# Altium schematic sheet MIPI_DISPLAY-SHEET.SchDoc
size A4; SheetNumber: 6; SheetTotal: 10
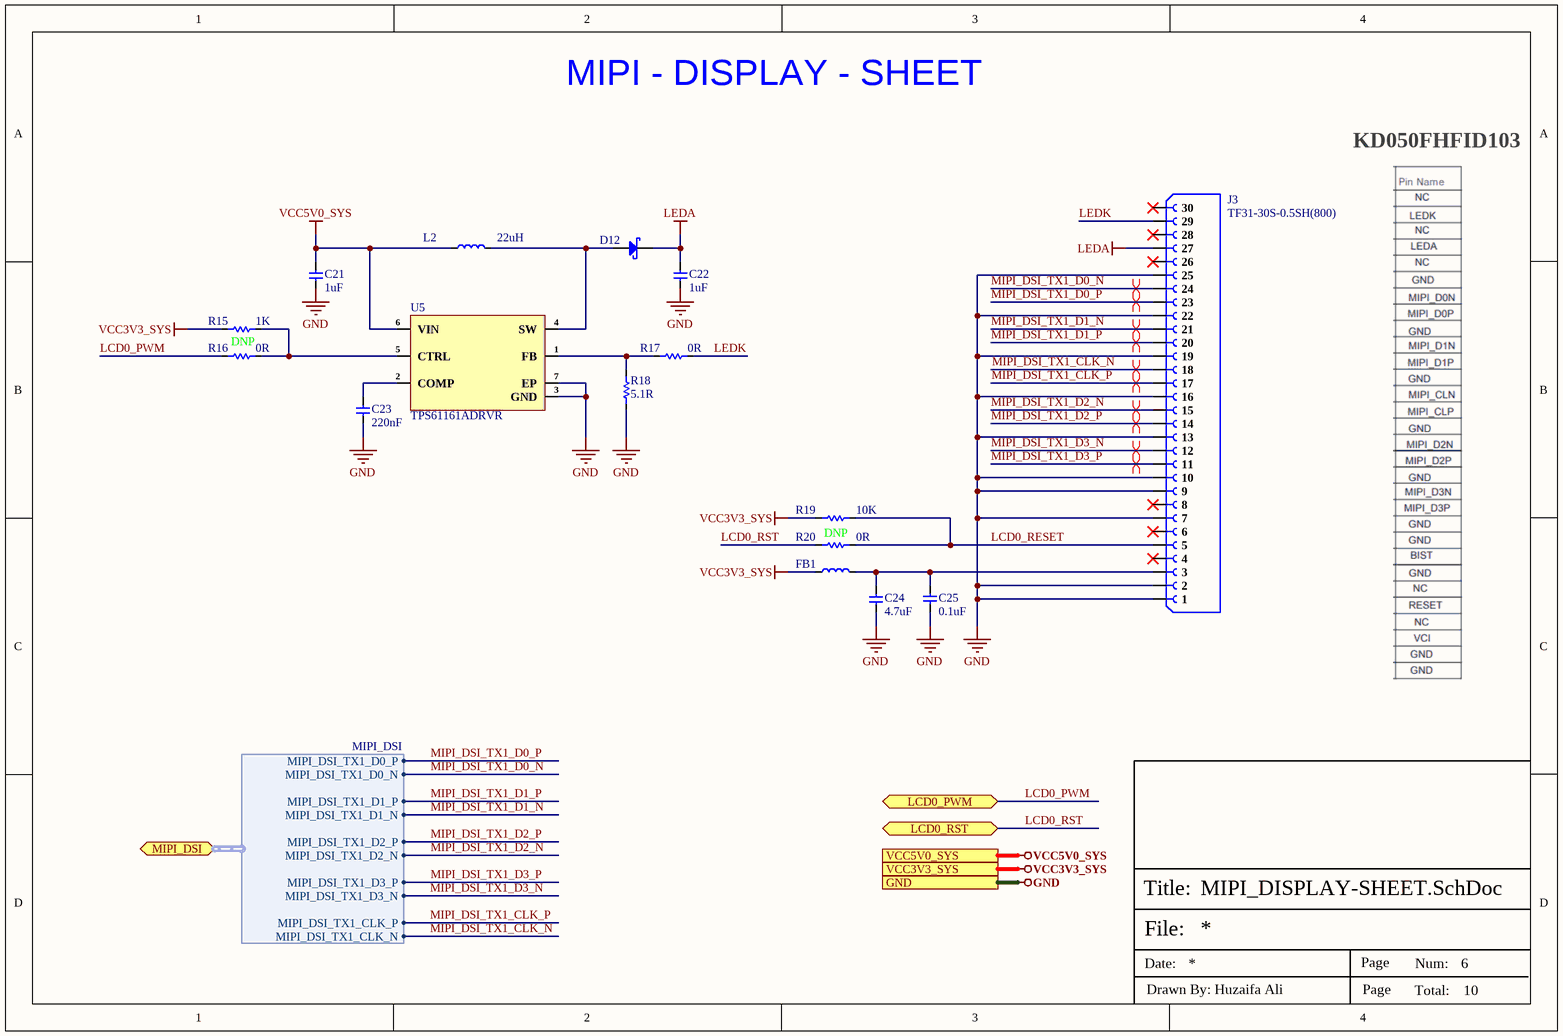
[diagram p0: MIPI_DISPLAY-SHEET.SchDoc]

## Parts
C21  1uF  [Cap-0603]
C22  1uF  [Cap-0603]
C23  220nF  [Cap-0402]
C24  4.7uF  [Cap-0402]
C25  0.1uF  [Cap-0402]
D12  SS16  [SMA]  (value not drawn)
FB1  BLM18PG181SN1D  [IND-0603 (1608 Metric)]  (value not drawn)
J3  TF31-30S-0.5SH(800)  [TF31-30S-0.5SH(800)]
L2  22uH  [VLCF5020T-220MR75-1]
R15  1K  [Res-0402]
R16  DNP  [Res-0402]
R17  0R  [Res-0402]
R18  5.1R  [RES-0805]
R19  10K  [Res-0402]
R20  DNP  [Res-0402]
U5  TPS61161ADRVR  [WSON-6-EP(2x2)]

## Ports
GND (see CAN_SHEET[3D], GPS_INTERFACE_SHEET[3D], HDMI2.0_SHEET[3D], JOYSTICK_BUTTON_SHEET[3D], MISCELLANEOUS_SHEET[3D], POWER_SHEET[3C], radxa_CM3J_SHEET-1[4C], radxa_CM3J_SHEET-2[3D], TYPE-C_INTERFACE_SHEET[3D]), LCD0_PWM (bidir, see radxa_CM3J_SHEET-1[4C]), LCD0_RST (bidir, see radxa_CM3J_SHEET-1[4C]), MIPI_DSI (bidir, harness MIPI_DSI, see radxa_CM3J_SHEET-2[1D]), VCC3V3_SYS (see GPS_INTERFACE_SHEET[3D], HDMI2.0_SHEET[3D], MISCELLANEOUS_SHEET[3D], POWER_SHEET[3C]), VCC5V0_SYS (see CAN_SHEET[3D], HDMI2.0_SHEET[3D], POWER_SHEET[3C], radxa_CM3J_SHEET-1[4C], TYPE-C_INTERFACE_SHEET[3D])

## Harnesses
MIPI_DSI: MIPI_DSI_TX1_D0_P, MIPI_DSI_TX1_D0_N, MIPI_DSI_TX1_D1_P, MIPI_DSI_TX1_D1_N, MIPI_DSI_TX1_D2_P, MIPI_DSI_TX1_D2_N, MIPI_DSI_TX1_D3_P, MIPI_DSI_TX1_D3_N, MIPI_DSI_TX1_CLK_P, MIPI_DSI_TX1_CLK_N

## Nets
GND: C21.1 C22.1 C23.1 C24.1 C25.2 J3.1 J3.2 J3.7 J3.9 J3.10 J3.13 J3.16 J3.19 J3.22 J3.25 R18.1 U5.3(GND) U5.7(EP) ; port GND
LEDA: C22.2 D12.1(K) J3.27
VCC3V3_SYS: FB1.1 R15.2 R19.2 ; port VCC3V3_SYS
VCC5V0_SYS: C21.2 L2.1 U5.6(VIN) ; port VCC5V0_SYS
LCD0_PWM: R16.1 ; port LCD0_PWM
LCD0_RESET: J3.5 R19.1 R20.2
LCD0_RST: R20.1 ; port LCD0_RST
LEDK: J3.29 R17.2
MIPI_DSI_TX1_CLK_N: J3.18 ; port MIPI_DSI.MIPI_DSI_TX1_CLK_N
MIPI_DSI_TX1_CLK_P: J3.17 ; port MIPI_DSI.MIPI_DSI_TX1_CLK_P
MIPI_DSI_TX1_D0_N: J3.24 ; port MIPI_DSI.MIPI_DSI_TX1_D0_N
MIPI_DSI_TX1_D0_P: J3.23 ; port MIPI_DSI.MIPI_DSI_TX1_D0_P
MIPI_DSI_TX1_D1_N: J3.21 ; port MIPI_DSI.MIPI_DSI_TX1_D1_N
MIPI_DSI_TX1_D1_P: J3.20 ; port MIPI_DSI.MIPI_DSI_TX1_D1_P
MIPI_DSI_TX1_D2_N: J3.15 ; port MIPI_DSI.MIPI_DSI_TX1_D2_N
MIPI_DSI_TX1_D2_P: J3.14 ; port MIPI_DSI.MIPI_DSI_TX1_D2_P
MIPI_DSI_TX1_D3_N: J3.12 ; port MIPI_DSI.MIPI_DSI_TX1_D3_N
MIPI_DSI_TX1_D3_P: J3.11 ; port MIPI_DSI.MIPI_DSI_TX1_D3_P
NetC23_2: C23.2 U5.2(COMP)
NetC24_2: C24.2 C25.1 FB1.2 J3.3
NetD12_2: D12.2(A) L2.2 U5.4(SW)
NetR15_1: R15.1 R16.2 U5.5(CTRL)
NetR17_1: R17.1 R18.2 U5.1(FB)

Not connected (* = marked no-connect by the designer): J3 4* 6* 8* 26* 28* 30*

## Layout directives
differential pair; differential pair class MIPI; rule Impedance Constraint [Min = 97.00    Max = 103.0    ]: MIPI_DSI_TX1_CLK_N, MIPI_DSI_TX1_CLK_P, MIPI_DSI_TX1_D0_N, MIPI_DSI_TX1_D0_P, MIPI_DSI_TX1_D1_N, MIPI_DSI_TX1_D1_P, MIPI_DSI_TX1_D2_N, MIPI_DSI_TX1_D2_P, MIPI_DSI_TX1_D3_N, MIPI_DSI_TX1_D3_P

## Notes on the sheet
- MIPI - DISPLAY - SHEET
- KD050FHFID103
- (near R16) 0R
- (near R20) 0R
- File:
- Title:
- Date:
- Page
- Num:
- Total:
- Drawn By: Huzaifa Ali

## Library data of the parts
C21 C22 = CL10A105KB8NNNC: CAP CER 1UF 50V X5R 0603; Manufacturer: Samsung; Material: 4241ConductorMaterial; Tolerance: 10%; Item Type: Capacitor; Supplier: Avnet; Supplier Part Number: CL10A105KB8NNNC; Manufacturer Part Number: CL10A105KB8NNNC; RoHS: Yes; Category: Ceramic Capacitors; Stock: 780446; Pricing: 4000=0.01632, 8000=0.01595, 16000=0.01557, 24000=0.0152, 32000=0.01482 (USD); Mounting Technology: Surface Mount; Case/Package: 0603; Case Code (Metric): 1608; Case Code (Imperial): 0603; Min Operating Temperature: -55°C; Max Operating Temperature: 85°C; Packaging: Tape and Reel; Value: 1uF; Voltage Rating: 50V; Dielectric: X5R; Series: CL; Voltage Rating (DC): 50V; Length: 1.6mm; Depth: 0.8mm; Radiation Hardening: No; RoHS Compliant: Yes; ComponentLink1URL: https://datasheet.ciiva.com/26877/getdatasheetpartid-753736-26877879.pdf?src-supplier=Verical; ComponentLink1Description: https://datasheet.ciiva.com/26877/getdatasheetpartid-753736-26877879.pdf?src-supplier=Verical; LCSC Part Number: C15849
C23 = CC0402KRX5R8BB224: CAP CER 0.22UF 25V X5R 0402; Manufacturer: Yageo; Item Type: Capacitors; Tolerance: 10%; Supplier 1: Mouser; Manufacturer Part Number: CC0402KRX5R8BB224; RoHS: Yes; Stock 1: 61266; Pricing 1: 1=0.10000, 10=0.03300, 50=0.03300, 100=0.02700, 1000=0.01500, 10000=0.01300 (USD); Mount: Surface Mount; Case/Package: 0402; Min Operating Temperature: -55°C; Max Operating Temperature: 85°C; Packaging: Tape and Reel; Capacitance: 220nF; Voltage Rating: 25V; Voltage Rating (DC): 25V; Dielectric: X5R; Length: 0.039inch; Width: 0.02inch; Thickness: 0.022inch; Lead Free: Lead Free; Halogen Free: Halogen Free; RoHS Compliant: Yes; ComponentLink1URL: http://www.yageo.com/documents/recent/UPY-GPHC_X5R_4V-to-50V_25.pdf?src-supplier=Digi-Key; ComponentLink1Description: http://www.yageo.com/documents/recent/UPY-GPHC_X5R_4V-to-50V_25.pdf?src-supplier=Digi-Key; ComponentLink2URL: https://www.yageo.com/upload/media/product/productsearch/datasheet/mlcc/UPY-GPHC_X5R_4V-to-50V_26.pdf?src-supplier=Digi-Key; ComponentLink2Description: https://www.yageo.com/upload/media/product/productsearch/datasheet/mlcc/UPY-GPHC_X5R_4V-to-50V_26.pdf?src-supplier=Digi-Key; ComponentLink3URL: http://www.yageo.com/documents/recent/UPY-GPHC_X5R_4V-to-50V_23.pdf?src-supplier=Digi-Key; ComponentLink3Description: http://www.yageo.com/documents/recent/UPY-GPHC_X5R_4V-to-50V_23.pdf?src-supplier=Digi-Key; Supplier Part Number 1: 603-CC402KRX5R8BB224; LCSC Part Number: C326836
C24 = CC0402KRX5R6BB475: CAP CER 4.7UF 10V X5R 0402; Manufacturer: Yageo; Tolerance: 10%; Supplier 1: Farnell; Manufacturer Part Number: CC0402KRX5R6BB475; RoHS: Yes; Category: Ceramic Capacitors; Stock 1: 20000; Pricing 1: 10000=0.02310, 50000=0.02100 (GBP); Mount: Surface Mount; Case/Package: 0402; Case Code (Imperial): 0402; Case Code (Metric): 1005; Min Operating Temperature: -55°C; Max Operating Temperature: 85°C; Packaging: Cut Tape; Capacitance: 4.7uF; Voltage Rating: 10V; RoHS Compliant: Yes; ComponentLink1URL: http://www.yageo.com/documents/recent/UPY-GPHC_X5R_4V-to-50V_25.pdf?src-supplier=Digi-Key; ComponentLink1Description: http://www.yageo.com/documents/recent/UPY-GPHC_X5R_4V-to-50V_25.pdf?src-supplier=Digi-Key; Supplier Part Number 1: 3871698; LCSC Part Number: C326586
C25 = GRM155R71H104ME14D: CAP CER 0.1UF 50V X7R 0402; Manufacturer: Murata; Tolerance: 20%; Capacitance: 100nF; Item Type: Capacitor; Supplier 1: Avnet; Manufacturer Part Number: GRM155R71H104ME14D; RoHS: Yes; Category: Ceramic Capacitors; Stock 1: 100000; Pricing 1: 10000=0.00444, 20000=0.00420, 40000=0.00396, 60000=0.00372, 80000=0.00348, 100000=0.00324, 1000000=0.00300 (USD); Mount: Surface Mount; Case/Package: 0402; Min Operating Temperature: -55°C; Max Operating Temperature: 125°C; Packaging: Cut Tape; Voltage Rating: 50V; Length: 0.039inch; Width: 0.02inch; Thickness: 0.022inch; RoHS Compliant: Yes; ComponentLink1URL: http://www.mouser.com/ds/2/281/c02e-2905.pdf?src-supplier=Mouser; ComponentLink1Description: http://www.mouser.com/ds/2/281/c02e-2905.pdf?src-supplier=Mouser; ComponentLink2URL: http://search.murata.co.jp/Ceramy/image/img/A01X/G101/ENG/GRM155R71H104ME14-01.pdf?src-supplier=Digi-Key; ComponentLink2Description: http://search.murata.co.jp/Ceramy/image/img/A01X/G101/ENG/GRM155R71H104ME14-01.pdf?src-supplier=Digi-Key; ComponentLink3URL: http://psearch.en.murata.com/capacitor/product/GRM155R71H104ME14%23.pdf?src-supplier=Avnet; ComponentLink3Description: http://psearch.en.murata.com/capacitor/product/GRM155R71H104ME14%23.pdf?src-supplier=Avnet; Supplier Part Number 1: GRM155R71H104ME14D; LCSC Part Number: C182412
D12 = SS16: 60V 700mV@1A 1A SMA(DO-214AC) Schottky Barrier Diodes (SBD) ROHS; Manufacturer: MDD; Item Type: Schottky Diode; Manufacturer Part Number: SS16; Package: SMA(DO-214AC); LCSC Part Number: C2481; ComponentLink1Description: LCSC; ComponentLink1URL: https://www.lcsc.com/product-detail/Schottky-Barrier-Diodes-SBD_MDD-Microdiode-Electronics-SS16_C2481.html
FB1 = BLM18PG181SN1D: 0603 180Ω ±25% DCR=0.09Ω 1.5A; Manufacturer: Murata; Manufacturer Series: BLM18P; Core Material: Ferrite; Material: Ferrite,Steel; Impedance: 180R; Number of Lines: 1; DC Resistance (DCR): 90mR; Test Frequency: 100MHz; Shielding: Unshielded; Item Type: Ferrite Bead; Supplier 1: Arrow Electronics; Manufacturer Part Number: BLM18PG181SN1D; RoHS: Yes; Category: Inductors; Stock 1: 13; Pricing 1: 1=0.08740, 10=0.06280 (USD); Case/Package: 0603; Number of Pins: 2; Case Code (Metric): 1608; Case Code (Imperial): 0603; Terminal Finish: Tin; Min Operating Temperature: -55°C; Max Operating Temperature: 125°C; Package Quantity: 1; Tolerance: 25%; Packaging: Tape and Reel; Current Rating: 1.5A; Max Current Rating: 1.5A; Max DC Current: 1.5A; Termination: SMD/SMT; DC Current: 1.5A; Number of Circuits: 1; Series: BLM18P; Number of Functions: 1; DC Resistance-Max: 90mR; Length: 1.6mm; Width: 0.8mm; Height: 0.8mm; Depth: 0.8mm; Radiation Hardening: No; REACH SVHC: No SVHC; Lead Free: Lead Free; RoHS Compliant: Yes; ComponentLink1URL: https://datasheet.ciiva.com/36526/1845021-36526048.pdf?src-supplier=Jameco; ComponentLink1Description: https://datasheet.ciiva.com/36526/1845021-36526048.pdf?src-supplier=Jameco; ComponentLink2URL: https://datasheet.ciiva.com/11800/0900766b81275ca5-11800854.pdf?src-supplier=RSComponents; ComponentLink2Description: https://datasheet.ciiva.com/11800/0900766b81275ca5-11800854.pdf?src-supplier=RSComponents; ComponentLink3URL: https://datasheet.ciiva.com/29347/442378-da-01-en-chip-drossel-0603-180r-1500ma-1-6x0-8mm-29347913.pdf?src-supplier=Conrad; ComponentLink3Description: https://datasheet.ciiva.com/29347/442378-da-01-en-chip-drossel-0603-180r-1500ma-1-6x0-8mm-29347913.pdf?src-supplier=Conrad; ComponentLink4URL: https://datasheet.ciiva.com/8021/5148-8021478.pdf?src-supplier=Element14; ComponentLink4Description: https://datasheet.ciiva.com/8021/5148-8021478.pdf?src-supplier=Element14; ComponentLink5URL: https://datasheet.ciiva.com/8021/5148-8021496.pdf?src-supplier=Element14; ComponentLink5Description: https://datasheet.ciiva.com/8021/5148-8021496.pdf?src-supplier=Element14; ComponentLink6URL: https://datasheet.ciiva.com/1012/l0110s0100blm18p-1012153.pdf?src-supplier=Digi-Key; ComponentLink6Description: https://datasheet.ciiva.com/1012/l0110s0100blm18p-1012153.pdf?src-supplier=Digi-Key; ComponentLink7URL: https://datasheet.ciiva.com/1012/l0110s0100blm18p-1012152.pdf?src-supplier=Digi-Key; ComponentLink7Description: https://datasheet.ciiva.com/1012/l0110s0100blm18p-1012152.pdf?src-supplier=Digi-Key; ComponentLink8URL: https://datasheet.ciiva.com/1012/l0110s0100blm18p-1012154.pdf?src-supplier=Digi-Key; ComponentLink8Description: https://datasheet.ciiva.com/1012/l0110s0100blm18p-1012154.pdf?src-supplier=Digi-Key; ComponentLink9URL: https://datasheet.ciiva.com/8084/l0110s0100blm18p-8084296.pdf?src-supplier=Avnet; ComponentLink9Description: https://datasheet.ciiva.com/8084/l0110s0100blm18p-8084296.pdf?src-supplier=Avnet; ComponentLink10URL: https://datasheet.ciiva.com/16394/l0110s0100blm18p-16394029.pdf?src-supplier=Future+Electronics; ComponentLink10Description: https://datasheet.ciiva.com/16394/l0110s0100blm18p-16394029.pdf?src-supplier=Future+Electronics; Supplier Part Number 1: BLM18PG181SN1D; LCSC Part Number: C82850
J3 = TF31-30S-0.5SH(800): CONN FFC BOTTOM 30POS 0.5MM R/A; Manufacturer: Hirose; Item Type: FFC / FPC Connector; Supplier: Digikey; Supplier Part Number: 26-TF31-30S-0.5SH(800)CT-ND; Manufacturer Part Number: TF31-30S-0.5SH(800); RoHS: Yes; Stock: 14095; Pricing: 1=2.37, 10=2.065, 25=1.9772, 50=1.9332, 100=1.8453, 250=1.66952, 500=1.53772, 1000=1.31805 (USD); ComponentLink1URL: https://www.hirose.com/product/download/?distributor=digikey&amp;type=specSheet&amp;lang=en&amp;num=TF31-30S-0.5SH(800)&src-supplier=Digikey; ComponentLink1Description: https://www.hirose.com/product/download/?distributor=digikey&amp;type=specSheet&amp;lang=en&amp;num=TF31-30S-0.5SH(800)&src-supplier=Digikey; ComponentLink2URL: https://datasheet.octopart.com/TF31-30S-0.5SH%28800%29-Hirose-datasheet-138123803.pdf?src-supplier=Sager+Electronics; ComponentLink2Description: https://datasheet.octopart.com/TF31-30S-0.5SH%28800%29-Hirose-datasheet-138123803.pdf?src-supplier=Sager+Electronics; LCSC Part Number: C5137133
L2 = VLCF5020T-220MR75-1: FIXED IND 22UH 750MA 496MOHM SMD; Manufacturer: TDK; Item Type: Inductors; Supplier: Avnet; LCSC Part Number: C87576; Manufacturer Part Number: VLCF5020T-220MR75-1; RoHS: Yes; Stock: 1000; Pricing: 500=0.2562 (USD); ComponentLink1URL: https://datasheet.ciiva.com/11800/0900766b807a173e-11800091.pdf?src-supplier=Rs; ComponentLink1Description: https://datasheet.ciiva.com/11800/0900766b807a173e-11800091.pdf?src-supplier=Rs; ComponentLink2URL: https://datasheet.ciiva.com/4956/e531-vlcf-18500-4956649.pdf?src-supplier=Mouser; ComponentLink2Description: https://datasheet.ciiva.com/4956/e531-vlcf-18500-4956649.pdf?src-supplier=Mouser; ComponentLink3URL: https://datasheet.ciiva.com/8045/516785-8045801.pdf?src-supplier=Element14; ComponentLink3Description: https://datasheet.ciiva.com/8045/516785-8045801.pdf?src-supplier=Element14; ComponentLink4URL: https://datasheet.ciiva.com/22725/516785-22725947.pdf?src-supplier=Element14; ComponentLink4Description: https://datasheet.ciiva.com/22725/516785-22725947.pdf?src-supplier=Element14
R15 = RC0402FR-071KL: RES 1K OHM 1% 1/16W 0402; Manufacturer: Yageo; Resistance: 1kR; Temperature Coefficient: 100ppm/°C; Voltage Rating (DC): 50V; Power Rating: 62.5mW; Max Power Dissipation: 63mW; Item Type: Resistor; Supplier 1: Avnet; Manufacturer Part Number: RC0402FR-071KL; RoHS: Yes; Category: Chip SMD Resistors; Stock 1: 13030000; Pricing 1: 10000=0.00085, 20000=0.00087, 40000=0.00084, 60000=0.00083, 80000=0.00079, 100000=0.00078, 1000000=0.00076 (USD); Case/Package: 0402; Number of Pins: 2; Case Code (Imperial): 0402; Case Code (Metric): 1005; Size Code: 0402; Min Operating Temperature: -55°C; Max Operating Temperature: 155°C; Resistor Type: Thick Film; Tolerance: 1%; Packaging: Tape and Reel; Voltage Rating: 50V; Termination: SMD/SMT; Features: Moisture Resistant; Series: RC; Number of Terminations: 2; Resistance Tolerance: 1%; Construction: Rectangular; Technology: THICK FILM; Length: 1mm; Width: 0.5mm; Height: 0.32mm; Depth: 0.5mm; Reach SVHC Compliant: Yes; Lead Free: Lead Free; RoHS Compliant: Yes; Military Standard: Not; ComponentLink1URL: https://datasheet.ciiva.com/11819/0900766b80c66297-11819477.pdf?src-supplier=RSComponents; ComponentLink1Description: https://datasheet.ciiva.com/11819/0900766b80c66297-11819477.pdf?src-supplier=RSComponents; ComponentLink2URL: https://datasheet.ciiva.com/7983/1018594-7983502.pdf?src-supplier=Element14; ComponentLink2Description: https://datasheet.ciiva.com/7983/1018594-7983502.pdf?src-supplier=Element14; ComponentLink3URL: https://datasheet.ciiva.com/22747/1018594-22747513.pdf?src-supplier=Element14; ComponentLink3Description: https://datasheet.ciiva.com/22747/1018594-22747513.pdf?src-supplier=Element14; ComponentLink4URL: https://datasheet.ciiva.com/12666/pyu-rc0402-51-rohs-l-6-r-12666741.pdf?src-supplier=Mouser; ComponentLink4Description: https://datasheet.ciiva.com/12666/pyu-rc0402-51-rohs-l-6-r-12666741.pdf?src-supplier=Mouser; ComponentLink5URL: https://datasheet.ciiva.com/7849/1018594-7849869.pdf?src-supplier=Element14; ComponentLink5Description: https://datasheet.ciiva.com/7849/1018594-7849869.pdf?src-supplier=Element14; ComponentLink6URL: https://datasheet.ciiva.com/7849/1018594-7849871.pdf?src-supplier=Element14; ComponentLink6Description: https://datasheet.ciiva.com/7849/1018594-7849871.pdf?src-supplier=Element14; ComponentLink7URL: https://datasheet.ciiva.com/17063/pyu-rc0402-51-rohs-l-6-r-17063193.pdf?src-supplier=Future+Electronics; ComponentLink7Description: https://datasheet.ciiva.com/17063/pyu-rc0402-51-rohs-l-6-r-17063193.pdf?src-supplier=Future+Electronics; Supplier Part Number 1: RC0402FR-071KL; LCSC Part Number: C106235
R16 R20 = RC0402FR-070RL: RES 0 OHM JUMPER 1/16W 0402; Manufacturer: Yageo; Item Type: Resistors; Resistance: 0R; Tolerance: 1%; Power Rating: 62.5mW; Voltage Rating: 50V; Temperature Coefficient: 200ppm/°C; Max Power Dissipation: 63mW; Supplier 1: Mouser; Manufacturer Part Number: RC0402FR-070RL; RoHS: Yes; Stock 1: 8556842; Pricing 1: 1=0.10000, 10=0.01400, 50=0.01400, 100=0.00600, 1000=0.00300, 5000=0.00200, 10000=0.00100 (USD); Mount: Surface Mount; Case/Package: 0402; Contact Plating: Tin,Matte; Case Code (Imperial): 0402; Case Code (Metric): 1005; Size Code: 0402; Min Operating Temperature: -55°C; Max Operating Temperature: 155°C; Resistor Type: Thick Film; Packaging: Tape and Reel; Termination: SMD/SMT; Features: Moisture Resistant; Series: RC; Number of Terminations: 2; Length: 1mm; Width: 0.5mm; Height: 0.35mm; Radiation Hardening: No; Lead Free: Lead Free; RoHS Compliant: Yes; ComponentLink1URL: https://datasheet.ciiva.com/8896/pyu-rc0402-51-rohs-l-6-8896149.pdf?src-supplier=Avnet; ComponentLink1Description: https://datasheet.ciiva.com/8896/pyu-rc0402-51-rohs-l-6-8896149.pdf?src-supplier=Avnet; ComponentLink2URL: https://datasheet.ciiva.com/16790/pyu-rc0402-51-rohs-l-6-r-16790444.pdf?src-supplier=Future+Electronics; ComponentLink2Description: https://datasheet.ciiva.com/16790/pyu-rc0402-51-rohs-l-6-r-16790444.pdf?src-supplier=Future+Electronics; Supplier Part Number 1: 603-RC0402FR-070RL; LCSC Part Number: C106231
R17 = RC0402FR-070RL: RES 0 OHM JUMPER 1/16W 0402; Manufacturer: Yageo; Item Type: Resistors; Tolerance: 1%; Power Rating: 62.5mW; Voltage Rating: 50V; Temperature Coefficient: 200ppm/°C; Max Power Dissipation: 63mW; Supplier 1: Mouser; Manufacturer Part Number: RC0402FR-070RL; RoHS: Yes; Stock 1: 8556842; Pricing 1: 1=0.10000, 10=0.01400, 50=0.01400, 100=0.00600, 1000=0.00300, 5000=0.00200, 10000=0.00100 (USD); Mount: Surface Mount; Case/Package: 0402; Contact Plating: Tin,Matte; Case Code (Imperial): 0402; Case Code (Metric): 1005; Size Code: 0402; Min Operating Temperature: -55°C; Max Operating Temperature: 155°C; Resistance: 0R; Resistor Type: Thick Film; Packaging: Tape and Reel; Termination: SMD/SMT; Features: Moisture Resistant; Series: RC; Number of Terminations: 2; Length: 1mm; Width: 0.5mm; Height: 0.35mm; Radiation Hardening: No; Lead Free: Lead Free; RoHS Compliant: Yes; ComponentLink1URL: https://datasheet.ciiva.com/8896/pyu-rc0402-51-rohs-l-6-8896149.pdf?src-supplier=Avnet; ComponentLink1Description: https://datasheet.ciiva.com/8896/pyu-rc0402-51-rohs-l-6-8896149.pdf?src-supplier=Avnet; ComponentLink2URL: https://datasheet.ciiva.com/16790/pyu-rc0402-51-rohs-l-6-r-16790444.pdf?src-supplier=Future+Electronics; ComponentLink2Description: https://datasheet.ciiva.com/16790/pyu-rc0402-51-rohs-l-6-r-16790444.pdf?src-supplier=Future+Electronics; Supplier Part Number 1: 603-RC0402FR-070RL; LCSC Part Number: C106231
R18 = RC0805JR-075R1L: RES 5.1 OHM 5% 1/8W 0805; Manufacturer: Yageo; Item Type: Resistor; Supplier: Future Electronics; Supplier Part Number: 9870346; Manufacturer Part Number: RC0805JR-075R1L; RoHS: Yes; Category: Chip SMD Resistors; Stock: 15000; Pricing: 5000=0.0054, 20000=0.0051, 75000=0.0048, 200000=0.0046, 500000=0.0043 (USD); ComponentLink1URL: https://datasheet.ciiva.com/2456/pyu-r-int-thick-7-2456339.pdf?src-supplier=Digikey; ComponentLink1Description: https://datasheet.ciiva.com/2456/pyu-r-int-thick-7-2456339.pdf?src-supplier=Digikey; ComponentLink2URL: https://datasheet.ciiva.com/2456/pyu-r-int-thick-7-2456340.pdf?src-supplier=Digikey; ComponentLink2Description: https://datasheet.ciiva.com/2456/pyu-r-int-thick-7-2456340.pdf?src-supplier=Digikey; ComponentLink3URL: https://datasheet.ciiva.com/2456/pyu-r-int-thick-7-2456341.pdf?src-supplier=Digikey; ComponentLink3Description: https://datasheet.ciiva.com/2456/pyu-r-int-thick-7-2456341.pdf?src-supplier=Digikey; ComponentLink4URL: https://datasheet.ciiva.com/17045/rc0805-17045032.pdf?src-supplier=Future+Electronics; ComponentLink4Description: https://datasheet.ciiva.com/17045/rc0805-17045032.pdf?src-supplier=Future+Electronics; ComponentLink5URL: https://datasheet.ciiva.com/5595/rc0805-5595916.pdf?src-supplier=Mouser; ComponentLink5Description: https://datasheet.ciiva.com/5595/rc0805-5595916.pdf?src-supplier=Mouser
R19 = RC0402FR-0710KL: RES 10K OHM 1% 1/16W 0402; Manufacturer: Yageo; Resistance: 10kR; Voltage Rating (DC): 50V; Temperature Coefficient: 100ppm/°C; Power Rating: 62.5mW; Max Power Dissipation: 63mW; Item Type: Resistor; Supplier 1: Mouser; Manufacturer Part Number: RC0402FR-0710KL; RoHS: Yes; Category: Chip SMD Resistors; Stock 1: 18648329; Pricing 1: 1=0.10000, 10=0.01400, 50=0.01400, 100=0.00500, 1000=0.00300, 10000=0.00200 (USD); Case/Package: 0402; Number of Pins: 2; Case Code (Imperial): 0402; Case Code (Metric): 1005; Min Operating Temperature: -55°C; Max Operating Temperature: 155°C; Resistor Type: Thick Film; Tolerance: 1%; Packaging: Tape and Reel; Voltage Rating: 50V; Termination: SMD/SMT; Working Voltage: 50V; Number of Terminations: 2; Features: Moisture Resistant; Series: RC; Resistance Tolerance: 1%; Construction: Rectangular; Length: 1mm; Width: 0.5mm; Height: 0.32mm; Depth: 0.5mm; Lead Pitch: 0.2mm; REACH SVHC: No SVHC; Lead Free: Lead Free; RoHS Compliant: Yes; Military Standard: Not; ComponentLink1URL: https://datasheet.ciiva.com/7660/38568-7660787.pdf?src-supplier=Element14; ComponentLink1Description: https://datasheet.ciiva.com/7660/38568-7660787.pdf?src-supplier=Element14; ComponentLink2URL: https://datasheet.ciiva.com/7849/1686128-7849814.pdf?src-supplier=Element14; ComponentLink2Description: https://datasheet.ciiva.com/7849/1686128-7849814.pdf?src-supplier=Element14; ComponentLink3URL: https://datasheet.ciiva.com/7983/1018594-7983486.pdf?src-supplier=Element14; ComponentLink3Description: https://datasheet.ciiva.com/7983/1018594-7983486.pdf?src-supplier=Element14; ComponentLink4URL: https://datasheet.ciiva.com/22747/1018594-22747512.pdf?src-supplier=Element14; ComponentLink4Description: https://datasheet.ciiva.com/22747/1018594-22747512.pdf?src-supplier=Element14; ComponentLink5URL: https://datasheet.ciiva.com/12667/pyu-rc0402-51-rohs-l-6-r-12667067.pdf?src-supplier=Mouser; ComponentLink5Description: https://datasheet.ciiva.com/12667/pyu-rc0402-51-rohs-l-6-r-12667067.pdf?src-supplier=Mouser; ComponentLink6URL: https://datasheet.ciiva.com/7849/1784430-7849813.pdf?src-supplier=Element14; ComponentLink6Description: https://datasheet.ciiva.com/7849/1784430-7849813.pdf?src-supplier=Element14; ComponentLink7URL: https://datasheet.ciiva.com/7849/1784430-7849815.pdf?src-supplier=Element14; ComponentLink7Description: https://datasheet.ciiva.com/7849/1784430-7849815.pdf?src-supplier=Element14; Supplier Part Number 1: 603-RC0402FR-0710KL; LCSC Part Number: C60490
U5 = TPS61161ADRVR: IC LED DRV RGLTR PWM 700MA 6WSON; Manufacturer: Texas Instruments; Supplier: Mouser; Supplier Part Number: 595-TPS61161ADRVR; Manufacturer Part Number: TPS61161ADRVR; RoHS: Yes; Category: LED Drivers; Stock: 3931; Pricing: 1=1.35, 10=0.864, 50=0.864, 100=0.696, 1000=0.618, 10000=0.53 (USD); Length: 2mm; Width: 2mm; Height: 800um; Thickness: 750um; Lead Free: 5697LeadFree; ComponentLink1URL: https://datasheet.ciiva.com/15135/getdatasheetpartid-621302-15135612.pdf?src-supplier=Verical; ComponentLink1Description: https://datasheet.ciiva.com/15135/getdatasheetpartid-621302-15135612.pdf?src-supplier=Verical; ComponentLink2URL: https://datasheet.ciiva.com/12277/slvs937a-120933-12277974.pdf?src-supplier=Mouser; ComponentLink2Description: https://datasheet.ciiva.com/12277/slvs937a-120933-12277974.pdf?src-supplier=Mouser; ComponentLink3URL: https://datasheet.ciiva.com/1947/tps61161a-1947723.pdf?src-supplier=Digikey; ComponentLink3Description: https://datasheet.ciiva.com/1947/tps61161a-1947723.pdf?src-supplier=Digikey; ComponentLink4URL: https://datasheet.ciiva.com/1947/tps61161a-1947724.pdf?src-supplier=Digikey; ComponentLink4Description: https://datasheet.ciiva.com/1947/tps61161a-1947724.pdf?src-supplier=Digikey; ComponentLink5URL: https://datasheet.ciiva.com/1947/tps61161a-1947725.pdf?src-supplier=Digikey; ComponentLink5Description: https://datasheet.ciiva.com/1947/tps61161a-1947725.pdf?src-supplier=Digikey; ComponentLink6URL: https://datasheet.ciiva.com/3165/tps61161a-3165623.pdf?src-supplier=Avnet; ComponentLink6Description: https://datasheet.ciiva.com/3165/tps61161a-3165623.pdf?src-supplier=Avnet